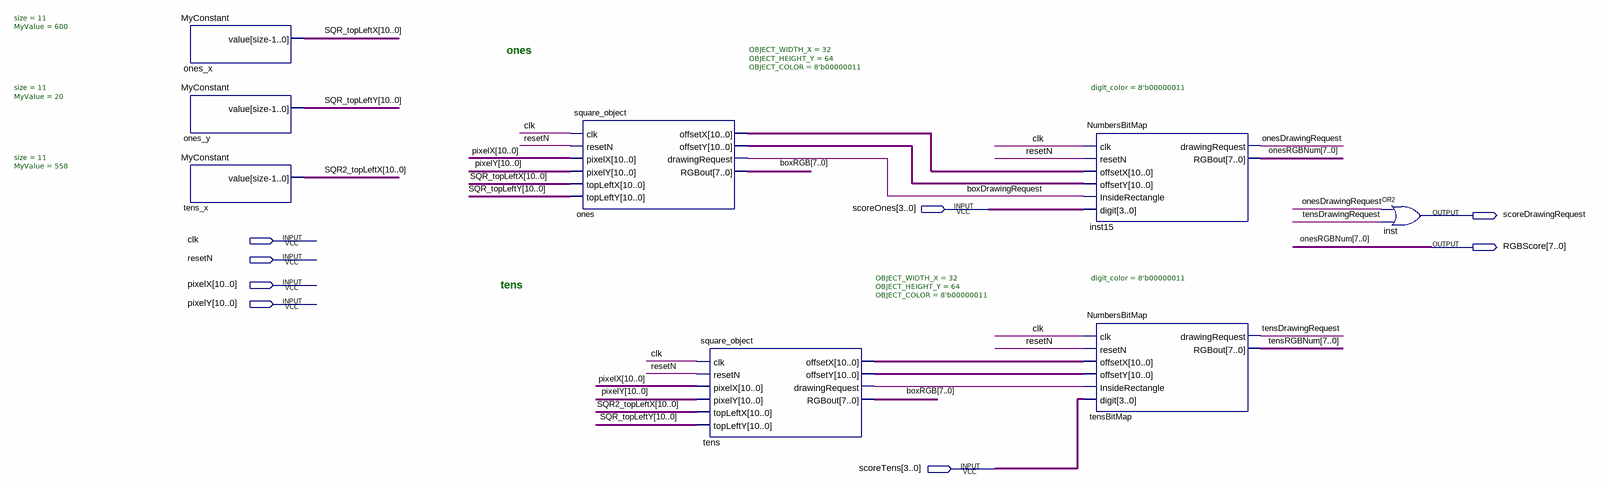
[diagram p0: schematic sheet]
// Quartus schematic SCORE_NUMBERS.bdf as structural Verilog: 8 symbols, 8 pins
module SCORE_NUMBERS (
  input  [3:0] scoreOnes,
  input  clk,
  input  resetN,
  input  [10:0] pixelX,
  input  [10:0] pixelY,
  input  [3:0] scoreTens,
  output scoreDrawingRequest,
  output [7:0] RGBScore
);

  wire boxDrawingRequest, onesDrawingRequest, tens_drawingrequest, tensDrawingRequest;
  wire [7:0] boxRGB, tensRGBNum;
  wire [10:0] ones_offsetx, ones_offsety, SQR2_topLeftX, SQR_topLeftX, SQR_topLeftY, tens_offsetx,
       tens_offsety;

  MyConstant #(.size(11), .MyValue(600)) ones_x (.value(SQR_topLeftX));
  MyConstant #(.size(11), .MyValue(20)) ones_y (.value(SQR_topLeftY));
  MyConstant #(.size(11), .MyValue(558)) tens_x (.value(SQR2_topLeftX));
  square_object #(.OBJECT_WIDTH_X(32), .OBJECT_HEIGHT_Y(64), .OBJECT_COLOR(8'b00000011)) ones (
    .clk(clk), .resetN(resetN), .pixelX(pixelX), .pixelY(pixelY), .topLeftX(SQR_topLeftX),
    .topLeftY(SQR_topLeftY), .offsetX(ones_offsetx), .offsetY(ones_offsety),
    .drawingRequest(boxDrawingRequest), .RGBout(boxRGB));
  square_object #(.OBJECT_WIDTH_X(32), .OBJECT_HEIGHT_Y(64), .OBJECT_COLOR(8'b00000011)) tens (
    .clk(clk), .resetN(resetN), .pixelX(pixelX), .pixelY(pixelY), .topLeftX(SQR2_topLeftX),
    .topLeftY(SQR_topLeftY), .offsetX(tens_offsetx), .offsetY(tens_offsety),
    .drawingRequest(tens_drawingrequest), .RGBout(boxRGB));
  NumbersBitMap #(.digit_color(8'b00000011)) inst15 (
    .clk(clk), .resetN(resetN), .offsetX(ones_offsetx), .offsetY(ones_offsety),
    .InsideRectangle(boxDrawingRequest), .digit(scoreOnes), .drawingRequest(onesDrawingRequest),
    .RGBout(RGBScore));
  NumbersBitMap #(.digit_color(8'b00000011)) tensBitMap (
    .clk(clk), .resetN(resetN), .offsetX(tens_offsetx), .offsetY(tens_offsety),
    .InsideRectangle(tens_drawingrequest), .digit(scoreTens), .drawingRequest(tensDrawingRequest),
    .RGBout(tensRGBNum));
  or inst (scoreDrawingRequest, onesDrawingRequest, tensDrawingRequest);

  // Other names for the same wires on the sheet: onesRGBNum[7:0] = RGBScore

  // Notes on the sheet:
  //   ones
  //   tens
endmodule
